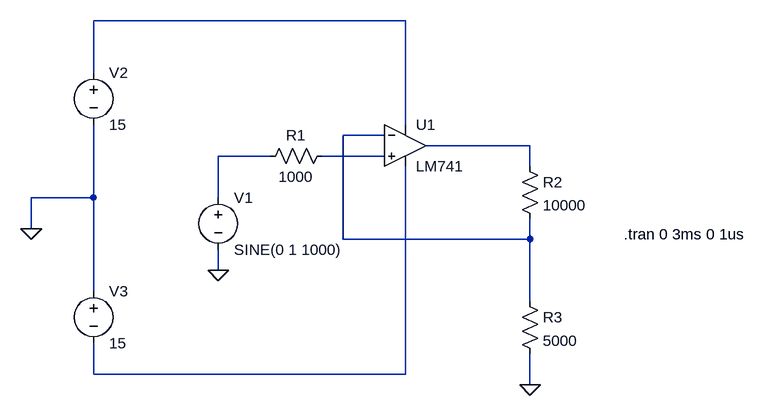
[diagram p0: schematic Draft5.asc]
Draft5.asc, the LTspice schematic file:
Version 4.1
SHEET 1 880 680
WIRE 160 -48 -320 -48
WIRE -320 32 -320 -48
WIRE 160 112 160 -48
WIRE 128 128 64 128
WIRE 352 144 192 144
WIRE -48 160 -128 160
WIRE 128 160 32 160
WIRE 352 176 352 144
WIRE -320 224 -320 112
WIRE -320 224 -416 224
WIRE -128 224 -128 160
WIRE -416 272 -416 224
WIRE 64 288 64 128
WIRE 352 288 352 256
WIRE 352 288 64 288
WIRE -128 336 -128 304
WIRE -320 368 -320 224
WIRE 352 384 352 288
WIRE -320 496 -320 448
WIRE 160 496 160 176
WIRE 160 496 -320 496
WIRE 352 512 352 464
FLAG -416 272 0
FLAG -128 336 0
FLAG 352 512 0
SYMBOL LM741 160 80 R0
SYMATTR InstName U1
SYMBOL voltage -128 208 R0
WINDOW 123 0 0 Left 0
WINDOW 39 0 0 Left 0
SYMATTR InstName V1
SYMATTR Value SINE(0 1 1000)
SYMBOL res 48 144 R90
WINDOW 0 0 56 VBottom 2
WINDOW 3 32 56 VTop 2
SYMATTR InstName R1
SYMATTR Value 1000
SYMBOL voltage -320 16 R0
WINDOW 123 0 0 Left 0
WINDOW 39 0 0 Left 0
SYMATTR InstName V2
SYMATTR Value 15
SYMBOL res 336 160 R0
SYMATTR InstName R2
SYMATTR Value 10000
SYMBOL res 336 368 R0
SYMATTR InstName R3
SYMATTR Value 5000
SYMBOL voltage -320 352 R0
SYMATTR InstName V3
SYMATTR Value 15
TEXT 496 280 Left 2 !.tran 0 3ms 0 1us

The netlist it stands for:
* Draft5.asc
X§U1 N005 N002 N001 N006 N003 LM741  ; pins In+ In- V+ V- OUT
V1 N004 0 SINE(0 1 1000)
R1 N005 N004 1000
V2 N001 0 15
R2 N003 N002 10000
R3 N002 0 5000
V3 0 N006 15
.tran 0 3ms 0 1us
.lib LM741.lib
.backanno
.end